# Altium project PCB_Smart_door.PrjPcb
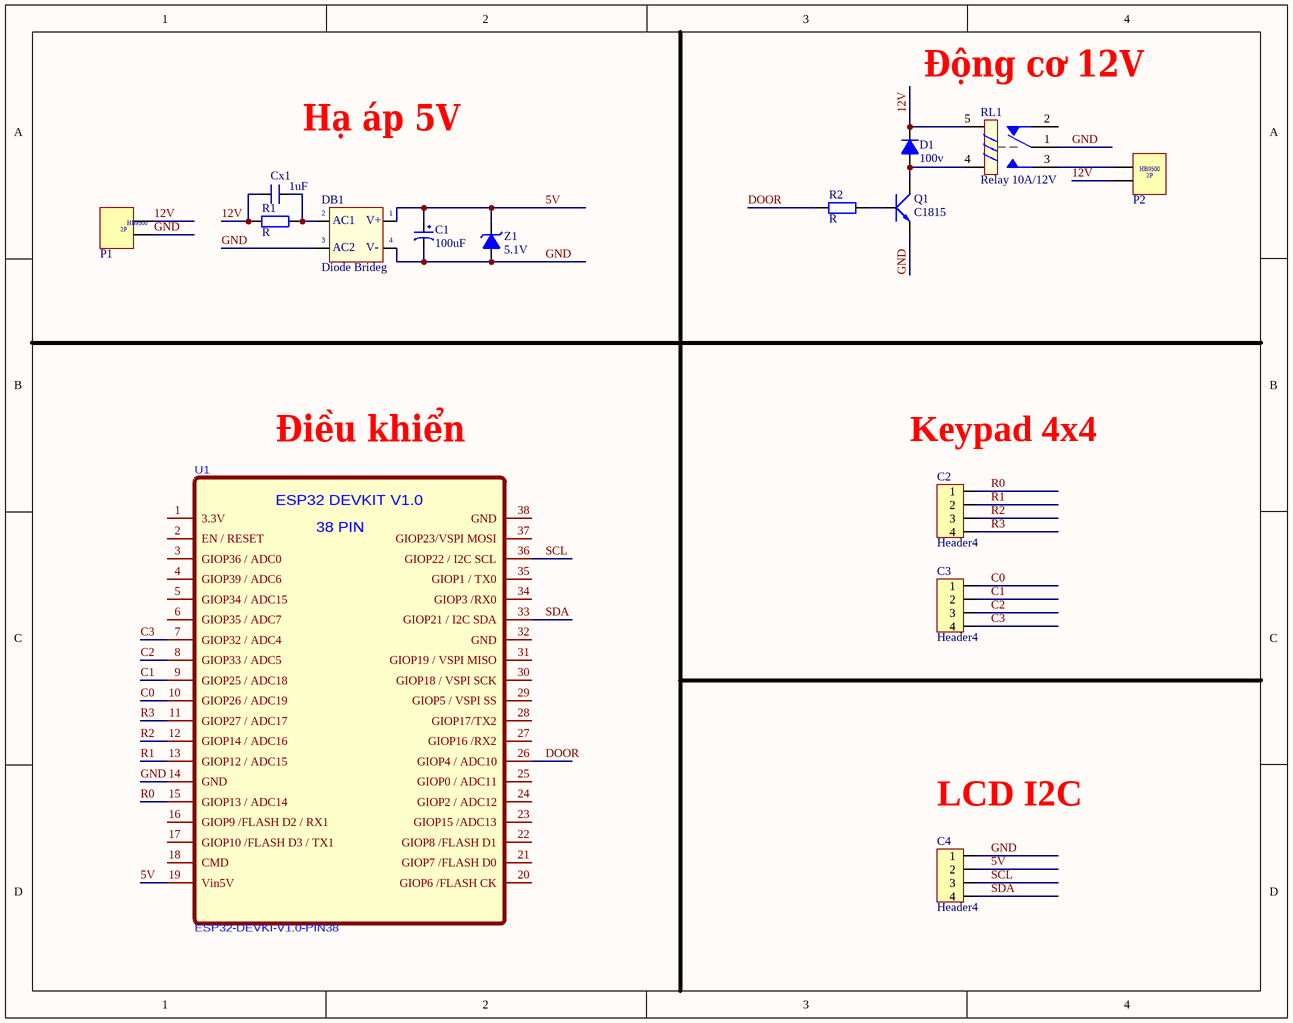
[diagram p0: Sheet1.SchDoc]
1 sheet, 15 parts. Net scope: global (net labels, ports and power ports of the same name join across sheets).
Board file: PCB1.PcbDoc

## Sheet Sheet1.SchDoc
size A; SheetNumber: 1; SheetTotal: 1

### Parts
C1  100uF  [tu hoa 5mm]
C2  Header4  [HDR4]
C3  Header4  [HDR4]
C4  Header4  [HDR4]
Cx1  1uF  [CN1]
D1  100v  [DIODE 1A]
DB1  Diode Brideg  [CAU 1A]
P1  HB9500-2P  [HB9500-2P]  (value not drawn)
P2  HB9500-2P  [HB9500-2P]  (value not drawn)
Q1  C1815  [TO92]
R1  value R  [DIEN TRO 1/4 W]  (hidden comment: 100K)
R2  value R  [DIEN TRO 1/4 W]  (hidden comment: 510)
RL1  Relay 10A/12V  [RELAY 5]
U1  ESP32-DEVKI-V1.0-PIN38  [ESP32-DEVKIT-V1.0-38PIN]
Z1  5.1V  [D1A]

### Nets
5V: C1.1 C4.2 DB1.1(+V_OUT) U1.19(Vin5V) Z1.2(K)
12V: Cx1.1 D1.2(K) P1.1 P2.2 R1.1 RL1.5
C0: C3.1 U1.10(GIOP26_/_ADC19)
C1: C3.2 U1.9(GIOP25_/_ADC18)
C2: C3.3 U1.8(GIOP33_/_ADC5)
C3: C3.4 U1.7(GIOP32_/_ADC4)
DOOR: R2.1 U1.26(GIOP4_/_ADC10)
GND: C1.2 C4.1 DB1.3(AC2) DB1.4(-V_OUT) P1.2 Q1.1(E) RL1.1 U1.14(GND) Z1.1(A)
R0: C2.1 U1.15(GIOP13_/_ADC14)
R1: C2.2 U1.13(GIOP12_/_ADC15)
R2: C2.3 U1.12(GIOP14_/_ADC16)
R3: C2.4 U1.11(GIOP27_/_ADC17)
SCL: C4.3 U1.36(GIOP22_/_I2C_SCL)
SDA: C4.4 U1.33(GIOP21_/_I2C_SDA)
NetCx1_2: Cx1.2 DB1.2(AC1) R1.2
NetD1_1: D1.1(A) Q1.2(C) RL1.4
NetP2_1: P2.1 RL1.3
NetQ1_3: Q1.3(B) R2.2

Not connected (* = marked no-connect by the designer): RL1 2; U1 1(3.3V) 2(EN_/_RESET) 3(GIOP36_/_ADC0) 4(GIOP39_/_ADC6) 5(GIOP34_/_ADC15) 6(GIOP35_/_ADC7) 16(GIOP9_/FLASH_D2_/_RX1) 17(GIOP10_/FLASH_D3_/_TX1) 18(CMD) 20(GIOP6_/FLASH_CK) 21(GIOP7_/FLASH_D0) 22(GIOP8_/FLASH_D1) 23(GIOP15_/ADC13) 24(GIOP2_/_ADC12) 25(GIOP0_/_ADC11) 27(GIOP16_/RX2) 28(GIOP17/TX2) 29(GIOP5_/_VSPI_SS) 30(GIOP18_/_VSPI_SCK) 31(GIOP19_/_VSPI_MISO) 32(GND) 34(GIOP3_/RX0) 35(GIOP1_/_TX0) 37(GIOP23/VSPI_MOSI) 38(GND)

### Notes on the sheet
- Động cơ 12V
- Hạ áp 5V
- Điều khiển
- (near C2) Keypad 4x4
- (near C4) LCD I2C
- (in symbol DB) V+; V-
- (in symbol ESP32-DEVKI-V1.0-PIN38) ESP32 DEVKIT V1.0; 38 PIN
- (in symbol HB9500-2P) HB9500; 2P

### Library data of the parts
C1 = Tu Hoa 100uF 16V 5x7: Cắm; Don_Vi: Con; So_Chan: 2; Ten_Linh_Kien: Tụ Hóa 100uF 16V 5x7MM; Ma_Hang: MH001347; Chung_Loai: Cắm; Kieu_Chan: *
C2-C4 = Header4: Header IDC, 4 x 1 Pin Vertical 2.54mm Pitch (Non-Boxed, Male); Manufacturer: W¨¹rth Elektronik eiSos GmbH; partNo: 613002143121; ComponentLink1 Description: Manufacturer; ComponentLink2 Description: Datasheet; NoPins: 02; Created Date: 29 March 2013; ComponentLink1URL: http://www.we-online.com; ComponentLink2URL: http://katalog.we-online.de/em/datasheet/6130xx143121.pdf; Created by: Karrer Zheng
Cx1 = CAP-DIP: Cremic For Xtal 1pF => 100pF; Value: 33pF
D1 = Diode 1N4007: Cắm; Ten_Linh_Kien: Diode 1N4007 1A (DIP); Don_Vi: Con; Ma_Hang: MH001063; Ghi Chu: *; Kieu_Chan: *; Chung_Loai: Cắm
DB1 = DB: Convert AC to DC voltage, 4 pin; Value: Cau 1A
P1 P2 = HB9500-2P: Terminal Block, Header, 2P, 15A, 300VAC Rohs Compliant: Yes
Q1 = Trans C1815 DIP: NPN transistor; Value: C9014
R1 R2 = Res 1/4 W: Resistor; Published: 8-Jun-2000; LatestRevisionDate: 17-Jul-2002; LatestRevisionNote: Re-released for DXP Platform.; PackageReference: AXIAL-0.4; Publisher: Altium Limited
RL1 = Relay 5: Relay SPDT,10A - 12VDC 5 Pin; Value: Relay SPDT, 10A, 12V
Z1 = Diode Zener: Diode  Zener